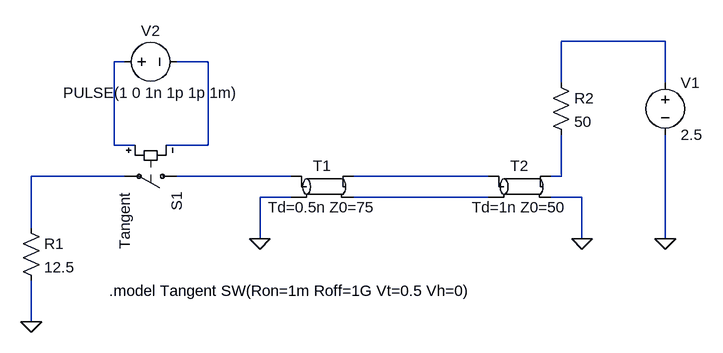
[diagram p0: schematic Draft5.asc]
Draft5.asc, the LTspice schematic file:
Version 4.1
SHEET 1 880 680
WIRE 768 -96 608 -96
WIRE -64 -64 -80 -64
WIRE 64 -64 16 -64
WIRE 608 -32 608 -96
WIRE 768 -32 768 -96
WIRE -80 64 -80 -64
WIRE -48 64 -80 64
WIRE 64 64 64 -64
WIRE 64 64 0 64
WIRE -64 112 -208 112
WIRE 192 112 16 112
WIRE 496 112 288 112
WIRE 608 112 608 48
WIRE 608 112 592 112
WIRE 192 144 144 144
WIRE 496 144 288 144
WIRE 640 144 592 144
WIRE -208 192 -208 112
WIRE 144 208 144 144
WIRE 640 208 640 144
WIRE 768 208 768 48
WIRE -208 336 -208 272
FLAG -208 336 0
FLAG 144 208 0
FLAG 640 208 0
FLAG 768 208 0
SYMBOL res -224 176 R0
SYMATTR InstName R1
SYMATTR Value 12.5
SYMBOL sw 32 112 R90
SYMATTR InstName S1
SYMATTR Value Tangent
SYMBOL tline 240 128 R0
SYMATTR InstName T1
SYMATTR Value Td=0.5n Z0=75
SYMBOL tline 544 128 R0
SYMATTR InstName T2
SYMATTR Value Td=1n Z0=50
SYMBOL res 592 -48 R0
SYMATTR InstName R2
SYMATTR Value 50
SYMBOL voltage 768 -48 R0
WINDOW 123 0 0 Left 0
WINDOW 39 0 0 Left 0
SYMATTR InstName V1
SYMATTR Value 2.5
SYMBOL voltage -80 -64 R270
WINDOW 0 32 56 VTop 2
WINDOW 3 -32 56 VBottom 2
WINDOW 123 0 0 Left 0
WINDOW 39 0 0 Left 0
SYMATTR InstName V2
SYMATTR Value PULSE(1 0 1n 1p 1p 1m)
TEXT -88 288 Left 2 !.model Tangent SW(Ron=1m Roff=1G Vt=0.5 Vh=0)

The netlist it stands for:
* Draft5.asc
R1 N004 0 12.5
S1 N005 N004 N002 N003 Tangent
T1 N005 0 N006 N008 Td=0.5n Z0=75
T2 N006 N008 N007 0 Td=1n Z0=50
R2 N001 N007 50
V1 N001 0 2.5
V2 N002 N003 PULSE(1 0 1n 1p 1p 1m)
.model Tangent SW(Ron=1m Roff=1G Vt=0.5 Vh=0)
.backanno
.end